# Altium schematic sheet Bias_I.SchDoc: 10 - Canal de BIAS I / MZM simples
size A3; Project: CM5 Photonic Bias Controller; DocumentRev: R5; ProjectRev: R5; Version: Rev R6; SheetNumber: 11; SheetTotal: 17; Author: Carlos Renan; SCH_SCALE: N/A; Address1: UFCG; Address2: Referencia: VIRTUS CC; Address3: Campina Grande - PB; ProjectName: Controle automatico de BIAS para MZM/IQ - Projeto 3; DocumentName: Bias_I.SchDoc
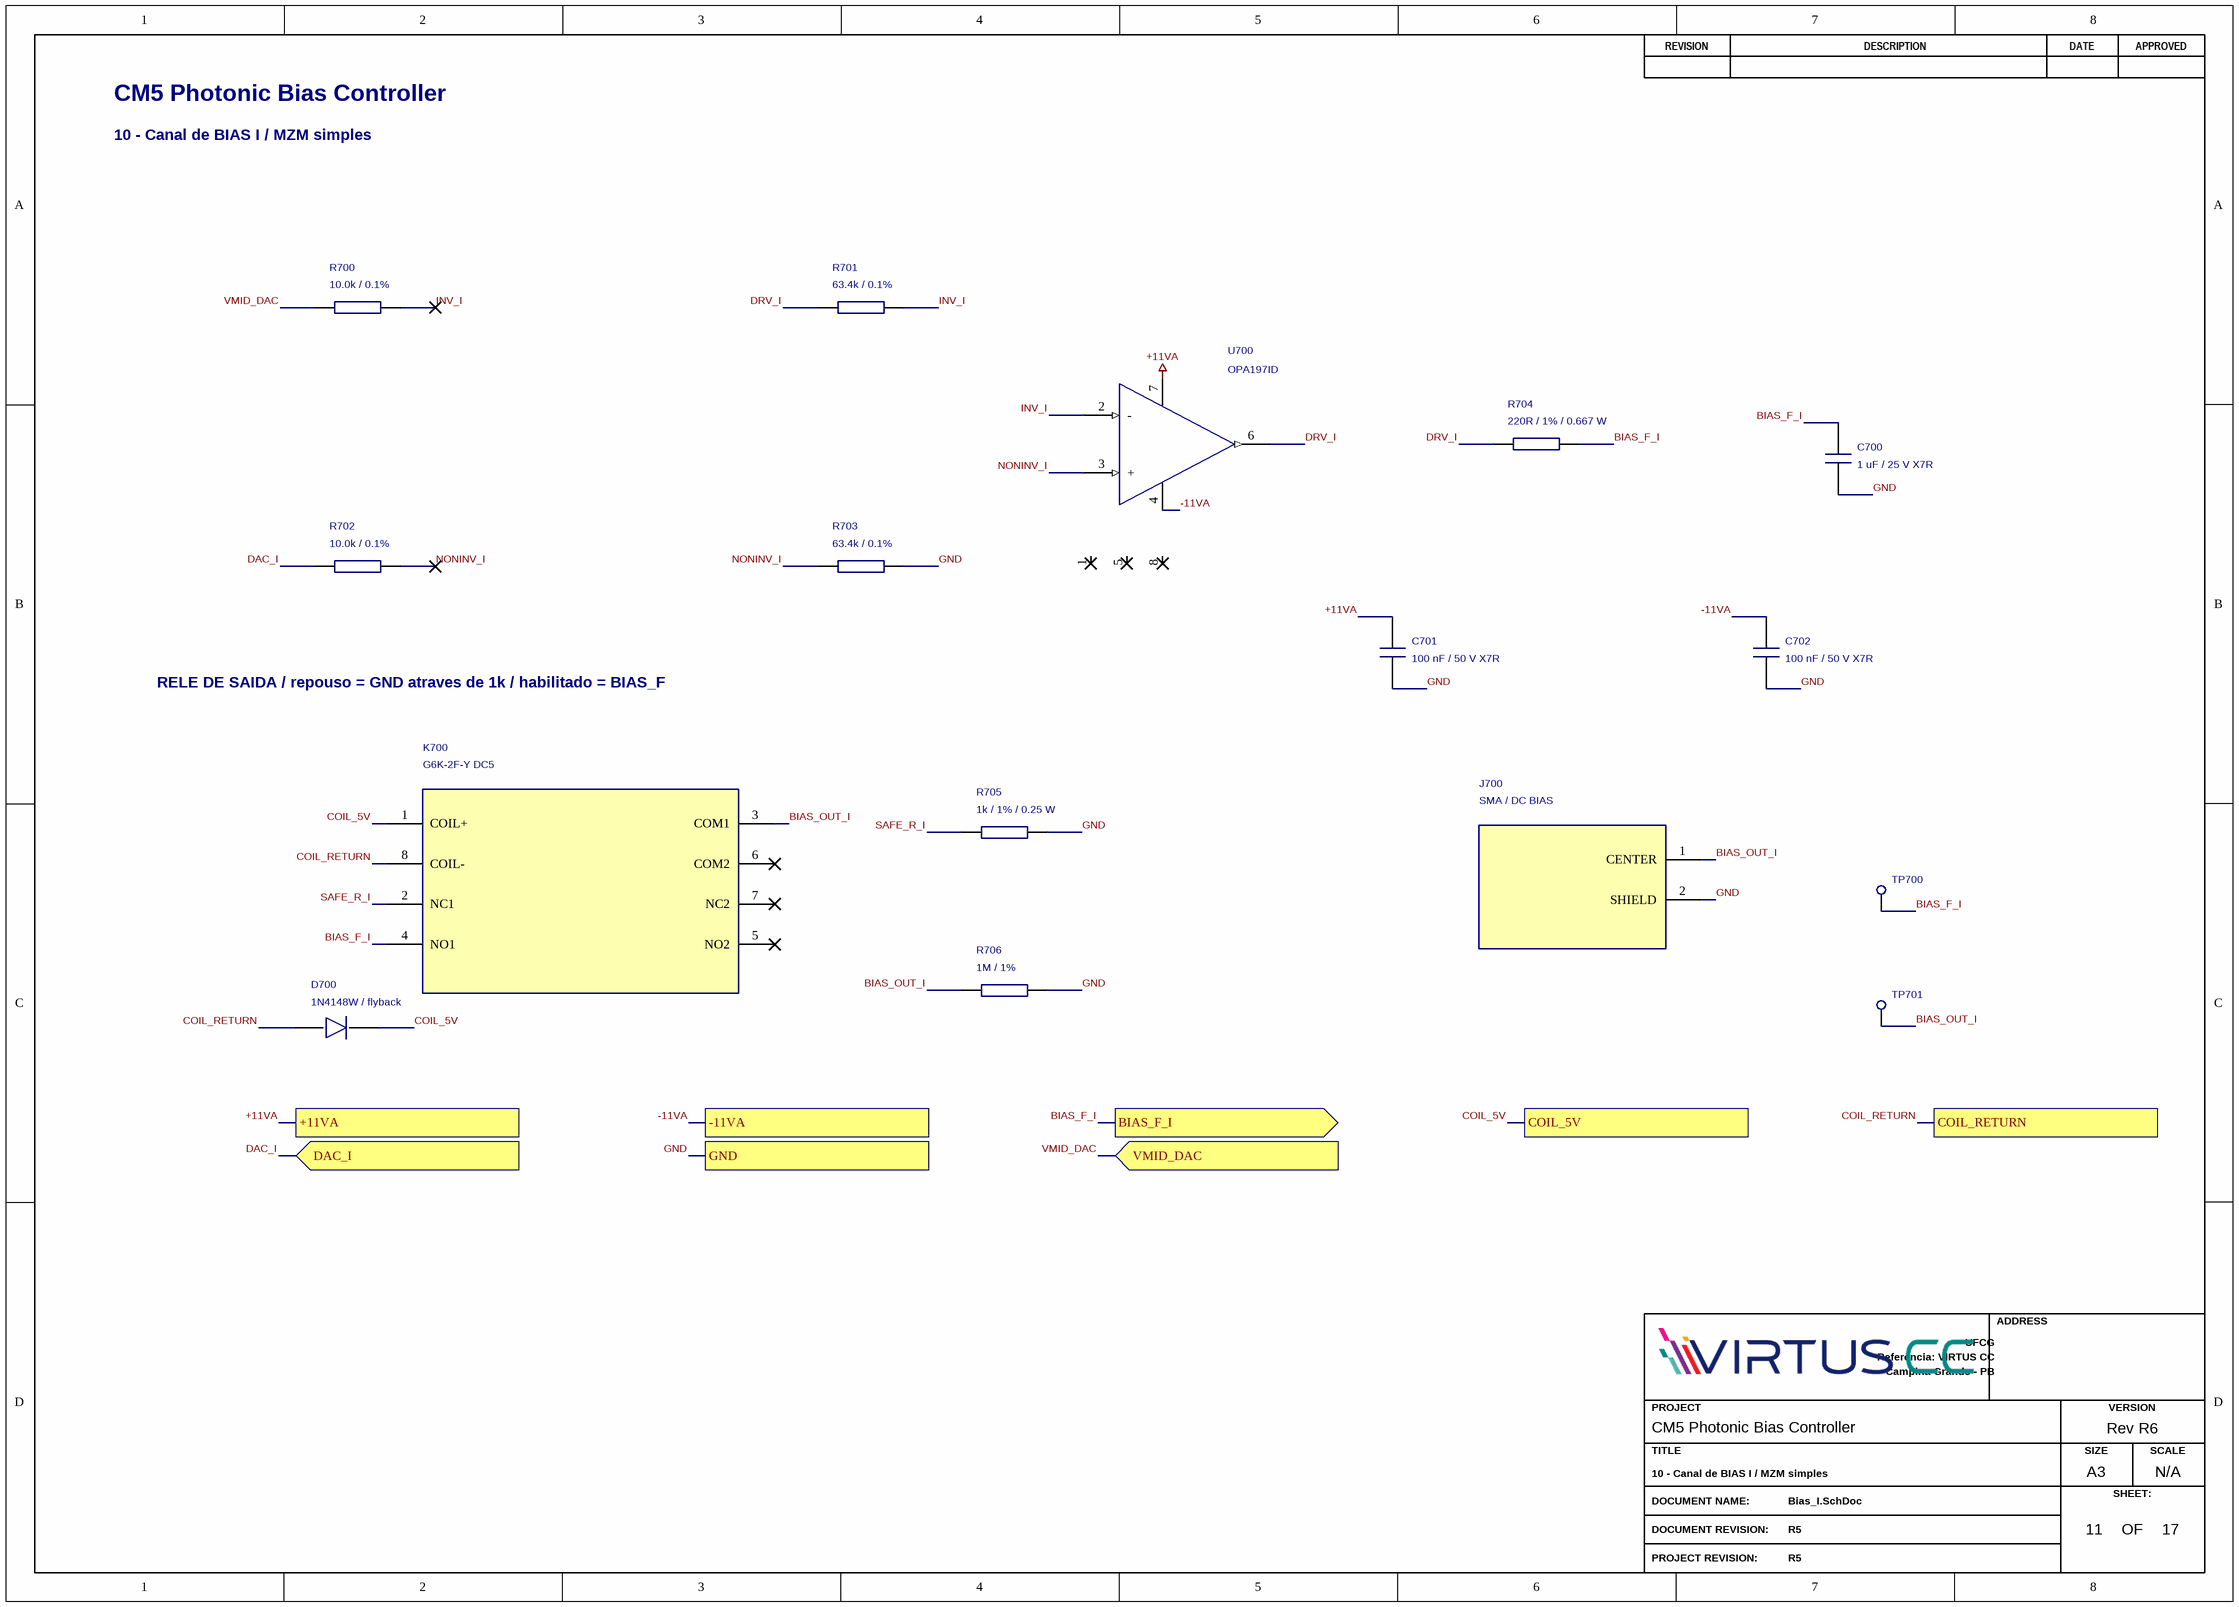
[diagram p0: Bias_I.SchDoc]

## Parts
C700  1 uF / 25 V X7R  [C0805]
C701  100 nF / 50 V X7R  [C0805]
C702  100 nF / 50 V X7R  [C0805]
D700  1N4148W / flyback  [SOD-123]
J700  SMA / DC BIAS  [SMA_132134]
K700  G6K-2F-Y DC5  [G6K_2F_Y]
R700  10.0k / 0.1%  [R-0603]
R701  63.4k / 0.1%  [R-0603]
R702  10.0k / 0.1%  [R-0603]
R703  63.4k / 0.1%  [R-0603]
R704  220R / 1% / 0.667 W  [R1206]
R705  1k / 1% / 0.25 W  [R1206]
R706  1M / 1%  [R-0603]
TP700  Testpoint  [TP06R]  (value not drawn)
TP701  Testpoint  [TP06R]  (value not drawn)
U700  OPA197ID  [SOIC8]

## Ports
+11VA, -11VA, BIAS_F_I (out), COIL_5V, COIL_RETURN, DAC_I (in), GND, VMID_DAC (in)

## Nets
+11VA: C701.1 U700.7(V+) ; port +11VA
-11VA: C702.1 U700.4(V-) ; port -11VA
BIAS_F_I: C700.1 K700.4(NO1) R704.2 TP700.1(TP) ; port BIAS_F_I
BIAS_OUT_I: J700.1(CENTER) K700.3(COM1) R706.1 TP701.1(TP)
COIL_5V: D700.1(K) K700.1(COIL+) ; port COIL_5V
COIL_RETURN: D700.2(A) K700.8(COIL-) ; port COIL_RETURN
DAC_I: R702.1 ; port DAC_I
DRV_I: R701.1 R704.1 U700.6(OUT)
GND: C700.2 C701.2 C702.2 J700.2(SHIELD) R703.2 R705.2 R706.2 ; port GND
INV_I: R700.2 R701.2 U700.2(-)
NONINV_I: R702.2 R703.1 U700.3(+)
SAFE_R_I: K700.2(NC1) R705.1
VMID_DAC: R700.1 ; port VMID_DAC

Not connected (* = marked no-connect by the designer): K700 5(NO2)* 6(COM2)* 7(NC2)*; U700 1(NC)* 5(NC)* 8(NC)*

## Notes on the sheet
- CM5 Photonic Bias Controller
- 10 - Canal de BIAS I / MZM simples
- RELE DE SAIDA / repouso = GND atraves de 1k / habilitado = BIAS_F
- REVISION
- DESCRIPTION
- DATE
- APPROVED
- ADDRESS
- PROJECT
- VERSION
- TITLE
- A3
- SIZE
- SCALE
- DOCUMENT NAME:
- DOCUMENT REVISION:
- OF
- SHEET:
- PROJECT REVISION:

## Library data of the parts
C700 = 1 uF: Manufacturer: KEMET; Manufacturer Part Number: C0805C105K3RACTU; Procurement Status: Busca por MPN; SKU e disponibilidade a confirmar; BOM Purchase: Yes; Manufacturer 1: KEMET; Manufacturer Part Number 1: C0805C105K3RACTU; Supplier 1: DigiKey; Supplier URL 1: https://www.digikey.com.br/pt/products/result?keywords=C0805C105K3RACTU; Supplier 2: Mouser; Supplier URL 2: https://br.mouser.com/c/?q=C0805C105K3RACTU; Datasheet: https://www.yageogroup.com/download/specsheet/C0805C105K3RACTU
C701 C702 = 100 nF: Manufacturer: KEMET; Manufacturer Part Number: C0805C104K5RACTU; Procurement Status: Busca por MPN; SKU e disponibilidade a confirmar; BOM Purchase: Yes; Manufacturer 1: KEMET; Manufacturer Part Number 1: C0805C104K5RACTU; Supplier 1: DigiKey; Supplier URL 1: https://www.digikey.com.br/pt/products/result?keywords=C0805C104K5RACTU; Supplier 2: Mouser; Supplier URL 2: https://br.mouser.com/c/?q=C0805C104K5RACTU; Datasheet: https://www.yageogroup.com/download/specsheet/C0805C104K5RACTU
D700 = 1N4148W: Manufacturer: Diodes Incorporated; Manufacturer Part Number: 1N4148W-7-F; Procurement Status: Busca por MPN; SKU e disponibilidade a confirmar; BOM Purchase: Yes; Manufacturer 1: Diodes Incorporated; Manufacturer Part Number 1: 1N4148W-7-F; Supplier 1: DigiKey; Supplier URL 1: https://www.digikey.com.br/pt/products/result?keywords=1N4148W-7-F; Supplier 2: Mouser; Supplier URL 2: https://br.mouser.com/c/?q=1N4148W-7-F; Datasheet: https://www.diodes.com/datasheet/download/1N4148W.pdf
J700 = SMA: Manufacturer: Amphenol RF; Manufacturer Part Number: 132134; Procurement Status: Busca por MPN; SKU e disponibilidade a confirmar; BOM Purchase: Yes; Manufacturer 1: Amphenol RF; Manufacturer Part Number 1: 132134; Supplier 1: DigiKey; Supplier URL 1: https://www.digikey.com.br/pt/products/result?keywords=132134; Supplier 2: Mouser; Supplier URL 2: https://br.mouser.com/c/?q=132134; Datasheet: https://www.amphenolrf.com/132134.html
K700 = G6K-2F-Y DC5: Manufacturer: Omron; Review: Bobina 1 positivo e 8 negativo; contato NC1=2, COM1=3, NO1=4.; Procurement Status: Busca por MPN; SKU e disponibilidade a confirmar; BOM Purchase: Yes; Manufacturer Part Number: G6K-2F-Y DC5; Manufacturer 1: Omron; Manufacturer Part Number 1: G6K-2F-Y DC5; Supplier 1: DigiKey; Supplier URL 1: https://www.digikey.com.br/pt/products/result?keywords=G6K-2F-Y%20DC5; Supplier 2: Mouser; Supplier URL 2: https://br.mouser.com/c/?q=G6K-2F-Y%20DC5; Datasheet: https://components.omron.com/us-en/datasheet_pdf/J156-E1.pdf
R700 R702 = 10.0k: Manufacturer: YAGEO; Manufacturer Part Number: RT0603BRD0710KL; Review: Filme fino, 0,1%, 25 ppm/K; 0,1 W. Verificar dissipacao em R210/R212 e matching dos drivers.; Procurement Status: Busca por MPN; SKU e disponibilidade a confirmar; BOM Purchase: Yes; Manufacturer 1: YAGEO; Manufacturer Part Number 1: RT0603BRD0710KL; Supplier 1: DigiKey; Supplier URL 1: https://www.digikey.com.br/pt/products/result?keywords=RT0603BRD0710KL; Supplier 2: Mouser; Supplier URL 2: https://br.mouser.com/c/?q=RT0603BRD0710KL; Datasheet: https://www.yageo.com/en/Product/Index/rchip
R701 R703 = 63.4k: Manufacturer: YAGEO; Manufacturer Part Number: RT0603BRD0763K4L; Review: Filme fino, 0,1%, 25 ppm/K; 0,1 W. Verificar dissipacao em R210/R212 e matching dos drivers.; Procurement Status: Busca por MPN; SKU e disponibilidade a confirmar; BOM Purchase: Yes; Manufacturer 1: YAGEO; Manufacturer Part Number 1: RT0603BRD0763K4L; Supplier 1: DigiKey; Supplier URL 1: https://www.digikey.com.br/pt/products/result?keywords=RT0603BRD0763K4L; Supplier 2: Mouser; Supplier URL 2: https://br.mouser.com/c/?q=RT0603BRD0763K4L; Datasheet: https://www.yageo.com/en/Product/Index/rchip
R704 = 220R: Manufacturer: Panasonic Industry; Manufacturer Part Number: ERJ-P08F2200V; Procurement Status: SKU conferido; consultar disponibilidade; BOM Purchase: Yes; Manufacturer 1: Panasonic Industry; Manufacturer Part Number 1: ERJ-P08F2200V; Supplier 1: DigiKey; Supplier Part Number 1: 10-ERJ-P08F2200VCT-ND; Supplier URL 1: https://www.digikey.com/en/products/detail/panasonic-industry/ERJ-P08F2200V/9812789; Supplier 2: Mouser; Supplier URL 2: https://br.mouser.com/c/?q=ERJ-P08F2200V; Datasheet: https://industrial.panasonic.com/cdbs/www-data/pdf/RDA0000/AOA0000C304.pdf
R705 = 1.00k: Manufacturer: YAGEO; Manufacturer Part Number: RC1206FR-071KL; Procurement Status: Busca por MPN; SKU e disponibilidade a confirmar; BOM Purchase: Yes; Manufacturer 1: YAGEO; Manufacturer Part Number 1: RC1206FR-071KL; Supplier 1: DigiKey; Supplier URL 1: https://www.digikey.com.br/pt/products/result?keywords=RC1206FR-071KL; Supplier 2: Mouser; Supplier URL 2: https://br.mouser.com/c/?q=RC1206FR-071KL; Datasheet: https://www.yageo.com/en/Product/Index/rchip
R706 = 1M: Manufacturer: YAGEO; Manufacturer Part Number: RC0603FR-071ML; Procurement Status: Busca por MPN; SKU e disponibilidade a confirmar; BOM Purchase: Yes; Manufacturer 1: YAGEO; Manufacturer Part Number 1: RC0603FR-071ML; Supplier 1: DigiKey; Supplier URL 1: https://www.digikey.com.br/pt/products/result?keywords=RC0603FR-071ML; Supplier 2: Mouser; Supplier URL 2: https://br.mouser.com/c/?q=RC0603FR-071ML; Datasheet: https://www.yageo.com/en/Product/Index/rchip
TP700 TP701 = Testpoint: Review: Testpoint em cobre; excluido da BOM de compra.; Procurement Status: Recurso de cobre da PCB; nao comprar; BOM Purchase: No - PCB feature
U700 = OPA197ID: Manufacturer: Texas Instruments; Procurement Status: Busca por MPN; SKU e disponibilidade a confirmar; BOM Purchase: Yes; Manufacturer Part Number: OPA197ID; Manufacturer 1: Texas Instruments; Manufacturer Part Number 1: OPA197ID; Supplier 1: DigiKey; Supplier URL 1: https://www.digikey.com.br/pt/products/result?keywords=OPA197ID; Supplier 2: Mouser; Supplier URL 2: https://br.mouser.com/c/?q=OPA197ID; Datasheet: https://www.ti.com/lit/ds/symlink/opa197.pdf